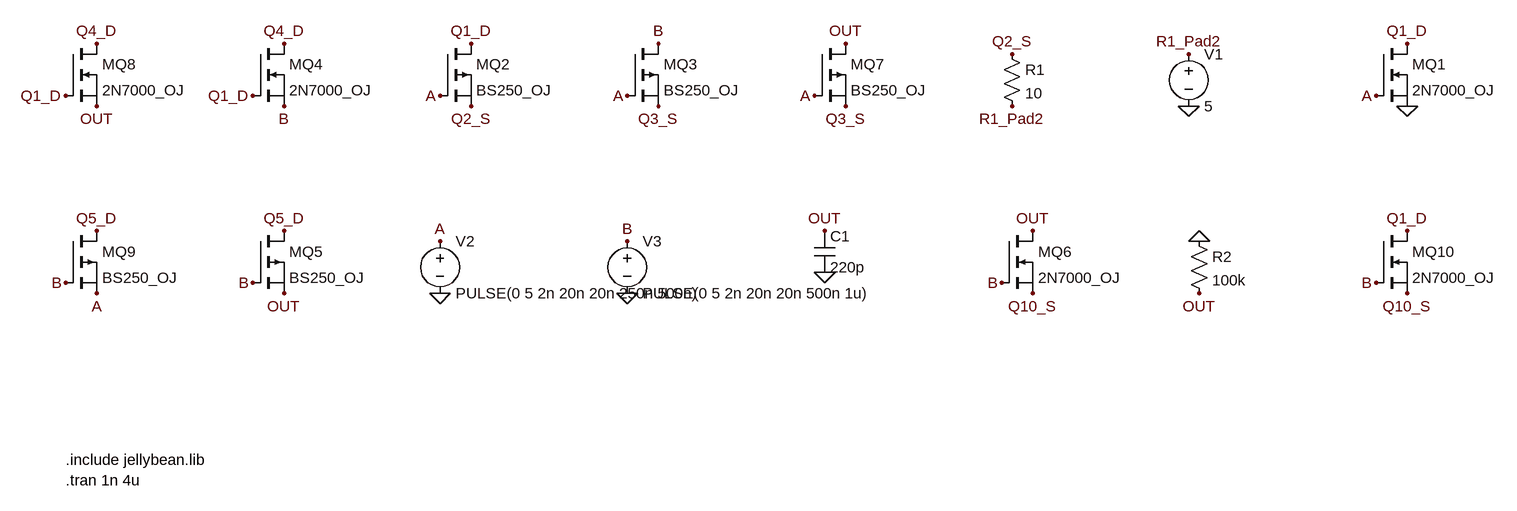
[diagram p0: schematic cmos_discrete_xor.asc]
cmos_discrete_xor.asc, the LTspice schematic file:
Version 4.1
SHEET 1 2400 1600
FLAG 48 0 Q4_D
FLAG 0 80 Q1_D
FLAG 48 96 OUT
FLAG 336 0 Q4_D
FLAG 288 80 Q1_D
FLAG 336 96 B
FLAG 624 0 Q1_D
FLAG 576 80 A
FLAG 624 96 Q2_S
FLAG 912 0 B
FLAG 864 80 A
FLAG 912 96 Q3_S
FLAG 1200 0 OUT
FLAG 1152 80 A
FLAG 1200 96 Q3_S
FLAG 1456 16 Q2_S
FLAG 1456 96 R1_Pad2
FLAG 1728 16 R1_Pad2
FLAG 1728 96 0
FLAG 2064 0 Q1_D
FLAG 2016 80 A
FLAG 2064 96 0
FLAG 48 288 Q5_D
FLAG 0 368 B
FLAG 48 384 A
FLAG 336 288 Q5_D
FLAG 288 368 B
FLAG 336 384 OUT
FLAG 576 304 A
FLAG 576 384 0
FLAG 864 304 B
FLAG 864 384 0
FLAG 1168 288 OUT
FLAG 1168 352 0
FLAG 1488 288 OUT
FLAG 1440 368 B
FLAG 1488 384 Q10_S
FLAG 1744 304 0
FLAG 1744 384 OUT
FLAG 2064 288 Q1_D
FLAG 2016 368 B
FLAG 2064 384 Q10_S
SYMBOL nmos 0 0 R0
SYMATTR InstName MQ8
SYMATTR Value 2N7000_OJ
SYMBOL nmos 288 0 R0
SYMATTR InstName MQ4
SYMATTR Value 2N7000_OJ
SYMBOL pmos 576 0 R0
SYMATTR InstName MQ2
SYMATTR Value BS250_OJ
SYMBOL pmos 864 0 R0
SYMATTR InstName MQ3
SYMATTR Value BS250_OJ
SYMBOL pmos 1152 0 R0
SYMATTR InstName MQ7
SYMATTR Value BS250_OJ
SYMBOL res 1440 0 R0
SYMATTR InstName R1
SYMATTR Value 10
SYMBOL voltage 1728 0 R0
SYMATTR InstName V1
SYMATTR Value 5
SYMBOL nmos 2016 0 R0
SYMATTR InstName MQ1
SYMATTR Value 2N7000_OJ
SYMBOL pmos 0 288 R0
SYMATTR InstName MQ9
SYMATTR Value BS250_OJ
SYMBOL pmos 288 288 R0
SYMATTR InstName MQ5
SYMATTR Value BS250_OJ
SYMBOL voltage 576 288 R0
SYMATTR InstName V2
SYMATTR Value PULSE(0 5 2n 20n 20n 250n 500n)
SYMBOL voltage 864 288 R0
SYMATTR InstName V3
SYMATTR Value PULSE(0 5 2n 20n 20n 500n 1u)
SYMBOL cap 1152 288 R0
SYMATTR InstName C1
SYMATTR Value 220p
SYMBOL nmos 1440 288 R0
SYMATTR InstName MQ6
SYMATTR Value 2N7000_OJ
SYMBOL res 1728 288 R0
SYMATTR InstName R2
SYMATTR Value 100k
SYMBOL nmos 2016 288 R0
SYMATTR InstName MQ10
SYMATTR Value 2N7000_OJ
TEXT 0 640 Left 2 !.include jellybean.lib
TEXT 0 672 Left 2 !.tran 1n 4u

The netlist it stands for:
* cmos_discrete_xor.asc
MQ8 Q4_D Q1_D OUT OUT 2N7000_OJ
MQ4 Q4_D Q1_D B B 2N7000_OJ
MQ2 Q1_D A Q2_S Q2_S BS250_OJ
MQ3 B A Q3_S Q3_S BS250_OJ
MQ7 OUT A Q3_S Q3_S BS250_OJ
R1 Q2_S R1_Pad2 10
V1 R1_Pad2 0 5
MQ1 Q1_D A 0 0 2N7000_OJ
MQ9 Q5_D B A A BS250_OJ
MQ5 Q5_D B OUT OUT BS250_OJ
V2 A 0 PULSE(0 5 2n 20n 20n 250n 500n)
V3 B 0 PULSE(0 5 2n 20n 20n 500n 1u)
C1 OUT 0 220p
MQ6 OUT B Q10_S Q10_S 2N7000_OJ
R2 0 OUT 100k
MQ10 Q1_D B Q10_S Q10_S 2N7000_OJ
.model NMOS NMOS
.model PMOS PMOS
.lib standard.mos
.include jellybean.lib
.tran 1n 4u
.backanno
.end